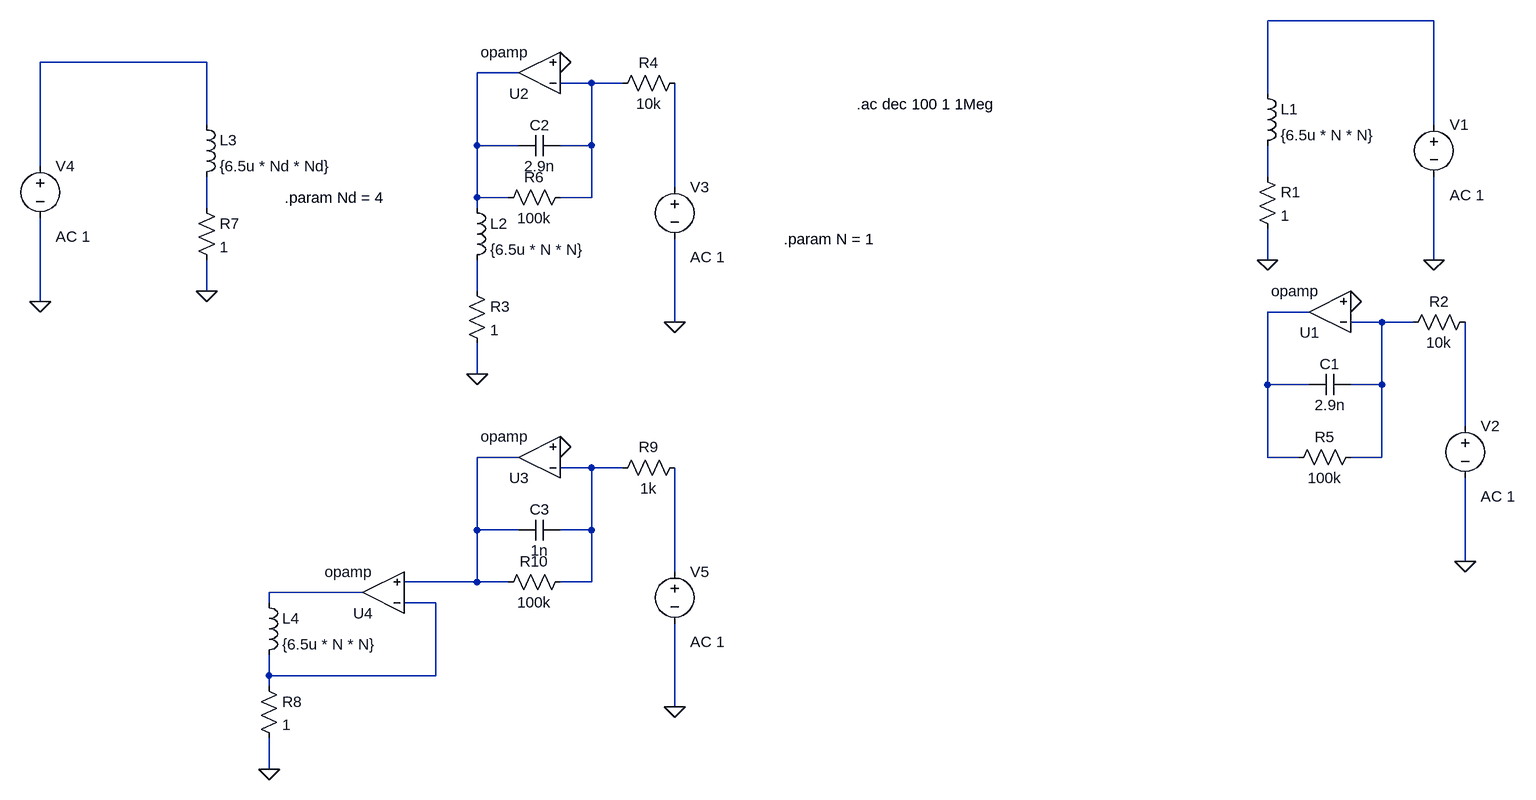
[diagram p0: schematic flux_gate_bw_estimations.asc]
flux_gate_bw_estimations.asc, the LTspice schematic file:
Version 4
SHEET 1 1472 1172
WIRE 432 0 176 0
WIRE -1456 64 -1712 64
WIRE -976 80 -1040 80
WIRE -864 96 -912 96
WIRE -816 96 -864 96
WIRE 176 112 176 0
WIRE -1456 160 -1456 64
WIRE 432 160 432 0
WIRE -1040 192 -1040 80
WIRE -976 192 -1040 192
WIRE -864 192 -864 96
WIRE -864 192 -912 192
WIRE -1712 224 -1712 64
WIRE 176 240 176 192
WIRE -736 256 -736 96
WIRE -1040 272 -1040 192
WIRE -992 272 -1040 272
WIRE -864 272 -864 192
WIRE -864 272 -912 272
WIRE -1456 288 -1456 240
WIRE -1040 288 -1040 272
WIRE 176 368 176 320
WIRE 432 368 432 240
WIRE -1456 416 -1456 368
WIRE -1040 416 -1040 368
WIRE -1712 432 -1712 304
WIRE 240 448 176 448
WIRE -736 464 -736 336
WIRE 352 464 304 464
WIRE 400 464 352 464
WIRE -1040 544 -1040 496
WIRE 176 560 176 448
WIRE 240 560 176 560
WIRE 352 560 352 464
WIRE 352 560 304 560
WIRE 480 624 480 464
WIRE -976 672 -1040 672
WIRE 176 672 176 560
WIRE 224 672 176 672
WIRE 352 672 352 560
WIRE 352 672 304 672
WIRE -864 688 -912 688
WIRE -816 688 -864 688
WIRE -1040 784 -1040 672
WIRE -976 784 -1040 784
WIRE -864 784 -864 688
WIRE -864 784 -912 784
WIRE 480 832 480 704
WIRE -736 848 -736 688
WIRE -1040 864 -1040 784
WIRE -1040 864 -1152 864
WIRE -992 864 -1040 864
WIRE -864 864 -864 784
WIRE -864 864 -912 864
WIRE -1216 880 -1360 880
WIRE -1360 896 -1360 880
WIRE -1104 896 -1152 896
WIRE -1360 1008 -1360 976
WIRE -1104 1008 -1104 896
WIRE -1104 1008 -1360 1008
WIRE -1360 1024 -1360 1008
WIRE -736 1056 -736 928
WIRE -1360 1152 -1360 1104
FLAG 176 368 0
FLAG 432 368 0
FLAG 304 432 0
FLAG 480 832 0
FLAG -1040 544 0
FLAG -912 64 0
FLAG -736 464 0
FLAG -1456 416 0
FLAG -1712 432 0
FLAG -1360 1152 0
FLAG -912 656 0
FLAG -736 1056 0
SYMBOL ind 160 96 R0
SYMATTR InstName L1
SYMATTR Value {6.5u * N * N}
SYMBOL res 160 224 R0
SYMATTR InstName R1
SYMATTR Value 1
SYMBOL voltage 432 144 R0
WINDOW 123 24 124 Left 2
WINDOW 39 0 0 Left 0
SYMATTR InstName V1
SYMATTR Value ""
SYMATTR Value2 AC 1
SYMBOL opamp 272 512 R180
SYMATTR InstName U1
SYMBOL cap 304 544 R90
WINDOW 0 0 32 VBottom 2
WINDOW 3 32 32 VTop 2
SYMATTR InstName C1
SYMATTR Value 2.9n
SYMBOL res 496 448 R90
WINDOW 0 0 56 VBottom 2
WINDOW 3 32 56 VTop 2
SYMATTR InstName R2
SYMATTR Value 10k
SYMBOL voltage 480 608 R0
WINDOW 123 24 124 Left 2
WINDOW 39 0 0 Left 0
SYMATTR InstName V2
SYMATTR Value ""
SYMATTR Value2 AC 1
SYMBOL ind -1056 272 R0
SYMATTR InstName L2
SYMATTR Value {6.5u * N * N}
SYMBOL res -1056 400 R0
SYMATTR InstName R3
SYMATTR Value 1
SYMBOL opamp -944 144 R180
SYMATTR InstName U2
SYMBOL cap -912 176 R90
WINDOW 0 0 32 VBottom 2
WINDOW 3 32 32 VTop 2
SYMATTR InstName C2
SYMATTR Value 2.9n
SYMBOL res -720 80 R90
WINDOW 0 0 56 VBottom 2
WINDOW 3 32 56 VTop 2
SYMATTR InstName R4
SYMATTR Value 10k
SYMBOL voltage -736 240 R0
WINDOW 123 24 124 Left 2
WINDOW 39 0 0 Left 0
SYMATTR InstName V3
SYMATTR Value ""
SYMATTR Value2 AC 1
SYMBOL res 320 656 R90
WINDOW 0 0 56 VBottom 2
WINDOW 3 32 56 VTop 2
SYMATTR InstName R5
SYMATTR Value 100k
SYMBOL res -896 256 R90
WINDOW 0 0 56 VBottom 2
WINDOW 3 32 56 VTop 2
SYMATTR InstName R6
SYMATTR Value 100k
SYMBOL ind -1472 144 R0
SYMATTR InstName L3
SYMATTR Value {6.5u * Nd * Nd}
SYMBOL res -1472 272 R0
SYMATTR InstName R7
SYMATTR Value 1
SYMBOL voltage -1712 208 R0
WINDOW 123 24 124 Left 2
WINDOW 39 0 0 Left 0
SYMATTR InstName V4
SYMATTR Value ""
SYMATTR Value2 AC 1
SYMBOL ind -1376 880 R0
SYMATTR InstName L4
SYMATTR Value {6.5u * N * N}
SYMBOL res -1376 1008 R0
SYMATTR InstName R8
SYMATTR Value 1
SYMBOL opamp -944 736 R180
SYMATTR InstName U3
SYMATTR SpiceLine2 GBW=1000Meg
SYMBOL cap -912 768 R90
WINDOW 0 0 32 VBottom 2
WINDOW 3 32 32 VTop 2
SYMATTR InstName C3
SYMATTR Value 1n
SYMBOL res -720 672 R90
WINDOW 0 0 56 VBottom 2
WINDOW 3 32 56 VTop 2
SYMATTR InstName R9
SYMATTR Value 1k
SYMBOL voltage -736 832 R0
WINDOW 123 24 124 Left 2
WINDOW 39 0 0 Left 0
SYMATTR InstName V5
SYMATTR Value ""
SYMATTR Value2 AC 1
SYMBOL res -896 848 R90
WINDOW 0 0 56 VBottom 2
WINDOW 3 32 56 VTop 2
SYMATTR InstName R10
SYMATTR Value 100k
SYMBOL opamp -1184 944 R180
SYMATTR InstName U4
SYMATTR SpiceLine2 GBW=1000Meg
TEXT -456 128 Left 2 !.ac dec 100 1 1Meg
TEXT -568 336 Left 2 !.param N = 1
TEXT -1336 272 Left 2 !.param Nd = 4

The netlist it stands for:
* flux_gate_bw_estimations.asc
L1 N001 N005 {6.5u * N * N}
R1 N005 0 1
V1 N001 0 AC 1
XU1 N010 0 N009 opamp Aol=100K GBW=10Meg  ; pins invin noninvin out
C1 N010 N009 2.9n
R2 N011 N010 10k
V2 N011 0 AC 1
L2 N003 N008 {6.5u * N * N}
R3 N008 0 1
XU2 N004 0 N003 opamp Aol=100K GBW=10Meg  ; pins invin noninvin out
C2 N004 N003 2.9n
R4 N006 N004 10k
V3 N006 0 AC 1
R5 N010 N009 100k
R6 N004 N003 100k
L3 N002 N007 {6.5u * Nd * Nd}
R7 N007 0 1
V4 N002 0 AC 1
L4 N015 N016 {6.5u * N * N}
R8 N016 0 1
XU3 N013 0 N012 opamp Aol=100K GBW=1000Meg  ; pins invin noninvin out
C3 N013 N012 1n
R9 N014 N013 1k
V5 N014 0 AC 1
R10 N013 N012 100k
XU4 N016 N012 N015 opamp Aol=100K GBW=1000Meg  ; pins invin noninvin out
.ac dec 100 1 1Meg
.param N = 1
.param Nd = 4
.backanno
.end